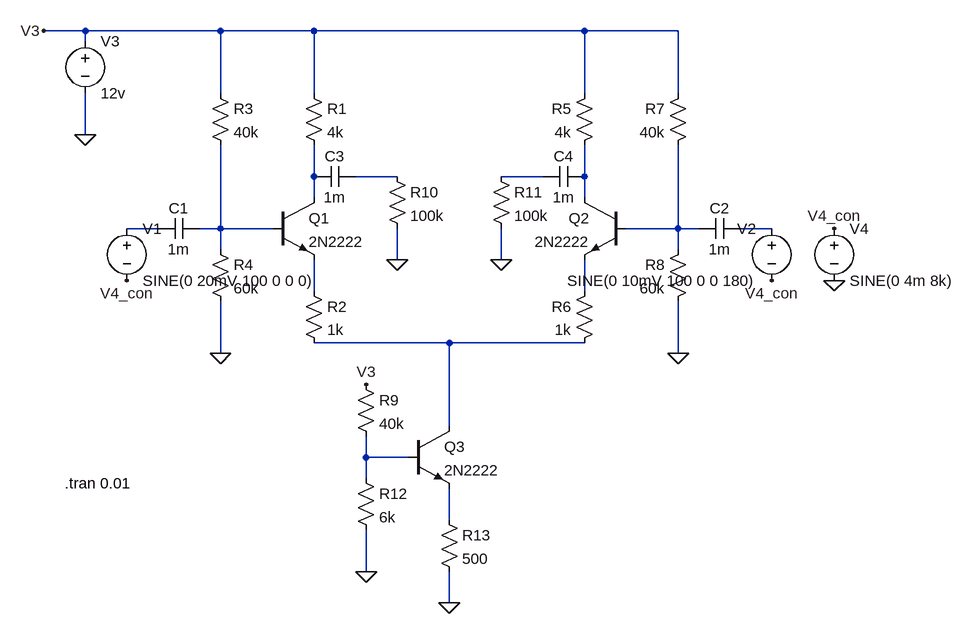
[diagram p0: schematic 05 AD__3_cu_sursa_de_curent.asc]
05 AD__3_cu_sursa_de_curent.asc, the LTspice schematic file:
Version 4
SHEET 1 1108 724
WIRE -256 -176 -320 -176
WIRE -48 -176 -256 -176
WIRE 96 -176 -48 -176
WIRE 512 -176 96 -176
WIRE 656 -176 512 -176
WIRE -256 -160 -256 -176
WIRE -48 -80 -48 -176
WIRE 96 -80 96 -176
WIRE 512 -80 512 -176
WIRE 656 -80 656 -176
WIRE -256 -16 -256 -80
WIRE 96 48 96 0
WIRE 224 48 160 48
WIRE 448 48 384 48
WIRE 512 48 512 0
WIRE 96 80 96 48
WIRE 512 80 512 48
WIRE -144 128 -192 128
WIRE -48 128 -48 0
WIRE -48 128 -80 128
WIRE 32 128 -48 128
WIRE 656 128 656 0
WIRE 656 128 576 128
WIRE 688 128 656 128
WIRE 800 128 752 128
WIRE -48 160 -48 128
WIRE 656 160 656 128
WIRE 224 176 224 128
WIRE 384 176 384 128
WIRE 96 224 96 176
WIRE 512 224 512 176
WIRE 304 304 96 304
WIRE 512 304 304 304
WIRE -48 320 -48 240
WIRE 656 320 656 240
WIRE 304 432 304 304
WIRE 176 480 176 448
WIRE 240 480 176 480
WIRE 176 512 176 480
WIRE 304 576 304 528
WIRE 176 656 176 592
WIRE 304 704 304 656
FLAG -48 320 0
FLAG 656 320 0
FLAG -256 -16 0
FLAG 224 176 0
FLAG 384 176 0
FLAG 176 656 0
FLAG 304 704 0
FLAG 896 208 0
FLAG 896 128 V4_con
FLAG 800 208 V4_con
FLAG -192 208 V4_con
FLAG -320 -176 V3
FLAG 176 368 V3
SYMBOL npn 32 80 R0
SYMATTR InstName Q1
SYMATTR Value 2N2222
SYMBOL res 80 -96 R0
SYMATTR InstName R1
SYMATTR Value 4k
SYMBOL res 80 208 R0
SYMATTR InstName R2
SYMATTR Value 1k
SYMBOL res -64 -96 R0
SYMATTR InstName R3
SYMATTR Value 40k
SYMBOL res -64 144 R0
SYMATTR InstName R4
SYMATTR Value 60k
SYMBOL cap -80 112 R90
WINDOW 0 0 32 VBottom 2
WINDOW 3 32 32 VTop 2
SYMATTR InstName C1
SYMATTR Value 1m
SYMBOL voltage -192 112 R0
WINDOW 123 0 0 Left 2
WINDOW 39 0 0 Left 2
SYMATTR InstName V1
SYMATTR Value SINE(0 20mV 100 0 0 0)
SYMBOL npn 576 80 M0
SYMATTR InstName Q2
SYMATTR Value 2N2222
SYMBOL res 528 -96 M0
SYMATTR InstName R5
SYMATTR Value 4k
SYMBOL res 528 208 M0
SYMATTR InstName R6
SYMATTR Value 1k
SYMBOL res 672 -96 M0
SYMATTR InstName R7
SYMATTR Value 40k
SYMBOL res 672 144 M0
SYMATTR InstName R8
SYMATTR Value 60k
SYMBOL cap 688 112 M90
WINDOW 0 0 32 VBottom 2
WINDOW 3 32 32 VTop 2
SYMATTR InstName C2
SYMATTR Value 1m
SYMBOL voltage 800 112 M0
WINDOW 123 0 0 Left 2
WINDOW 39 0 0 Left 2
SYMATTR InstName V2
SYMATTR Value SINE(0 10mV 100 0 0 180)
SYMBOL voltage -256 -176 R0
WINDOW 123 0 0 Left 2
WINDOW 39 0 0 Left 2
SYMATTR InstName V3
SYMATTR Value 12v
SYMBOL cap 160 32 R90
WINDOW 0 0 32 VBottom 2
WINDOW 3 32 32 VTop 2
SYMATTR InstName C3
SYMATTR Value 1m
SYMBOL res 208 32 R0
SYMATTR InstName R10
SYMATTR Value 100k
SYMBOL cap 512 32 R90
WINDOW 0 0 32 VBottom 2
WINDOW 3 32 32 VTop 2
SYMATTR InstName C4
SYMATTR Value 1m
SYMBOL res 368 32 R0
SYMATTR InstName R11
SYMATTR Value 100k
SYMBOL npn 240 432 R0
SYMATTR InstName Q3
SYMATTR Value 2N2222
SYMBOL res 160 352 R0
SYMATTR InstName R9
SYMATTR Value 40k
SYMBOL res 160 496 R0
SYMATTR InstName R12
SYMATTR Value 6k
SYMBOL res 288 560 R0
SYMATTR InstName R13
SYMATTR Value 500
SYMBOL voltage 896 112 R0
WINDOW 123 0 0 Left 2
WINDOW 39 0 0 Left 2
SYMATTR InstName V4
SYMATTR Value SINE(0 4m 8k)
TEXT -288 520 Left 2 !.tran 0.01

The netlist it stands for:
* 05 AD__3_cu_sursa_de_curent.asc
Q1 N001 N006 N009 0 2N2222
R1 V3 N001 4k
R2 N009 N011 1k
R3 V3 N006 40k
R4 N006 0 60k
C1 N006 N005 1m
V1 N005 V4_con SINE(0 20mV 100 0 0 0)
Q2 N004 N007 N010 0 2N2222
R5 V3 N004 4k
R6 N010 N011 1k
R7 V3 N007 40k
R8 N007 0 60k
C2 N007 N008 1m
V2 N008 V4_con SINE(0 10mV 100 0 0 180)
V3 V3 0 12v
C3 N002 N001 1m
R10 N002 0 100k
C4 N004 N003 1m
R11 N003 0 100k
Q3 N011 N012 N013 0 2N2222
R9 V3 N012 40k
R12 N012 0 6k
R13 N013 0 500
V4 V4_con 0 SINE(0 4m 8k)
.model NPN NPN
.model PNP PNP
.lib standard.bjt
.tran 0.01
.backanno
.end